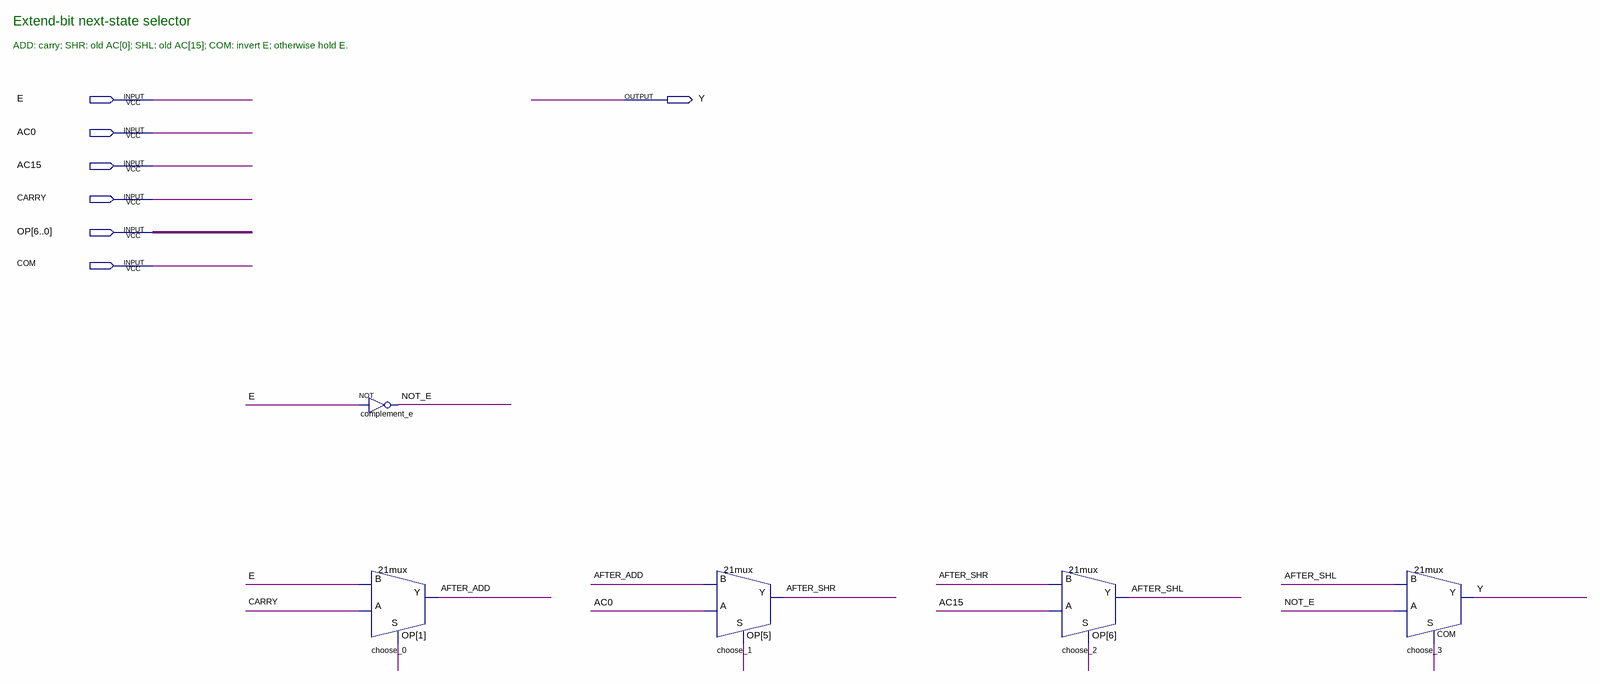
[diagram p0: schematic sheet]
// Quartus schematic extend_next.bdf as structural Verilog: 5 symbols, 7 pins
module extend_next (
  input  E,
  input  AC0,
  input  AC15,
  input  CARRY,
  input  [6:0] OP,
  input  COM,
  output Y
);

  wire AFTER_ADD, AFTER_SHL, AFTER_SHR, NOT_E;

  not complement_e (NOT_E, E);
  \21mux  choose_0 (.B(E), .A(CARRY), .S(OP[1]), .Y(AFTER_ADD));
  \21mux  choose_1 (.B(AFTER_ADD), .A(AC0), .S(OP[5]), .Y(AFTER_SHR));
  \21mux  choose_2 (.B(AFTER_SHR), .A(AC15), .S(OP[6]), .Y(AFTER_SHL));
  \21mux  choose_3 (.B(AFTER_SHL), .A(NOT_E), .S(COM), .Y(Y));

  // Notes on the sheet:
  //   Extend-bit next-state selector
  //   ADD: carry; SHR: old AC[0]; SHL: old AC[15]; COM: invert E; otherwise hold E.
endmodule
